# EasyEDA Pro project ProPrj_ROV_MINI_CTRL_2026-11-13.epro, schematic ROV_MINI_CTRL_V2.0.0（无电调）

## Sheets
1 MCU: Assembly Variant: Basic; Board Name: Board3; Create Date: 2026-10-08; Page Name: MCU; Project Name: ROV_MINI_CTRL; Schematic Name: ROV_MINI_CTRL_V2.0.0（无电调）; Update Date: 2026-10-08; Company: 嘉立创EDA; Page Size: A3; Version: V1.0
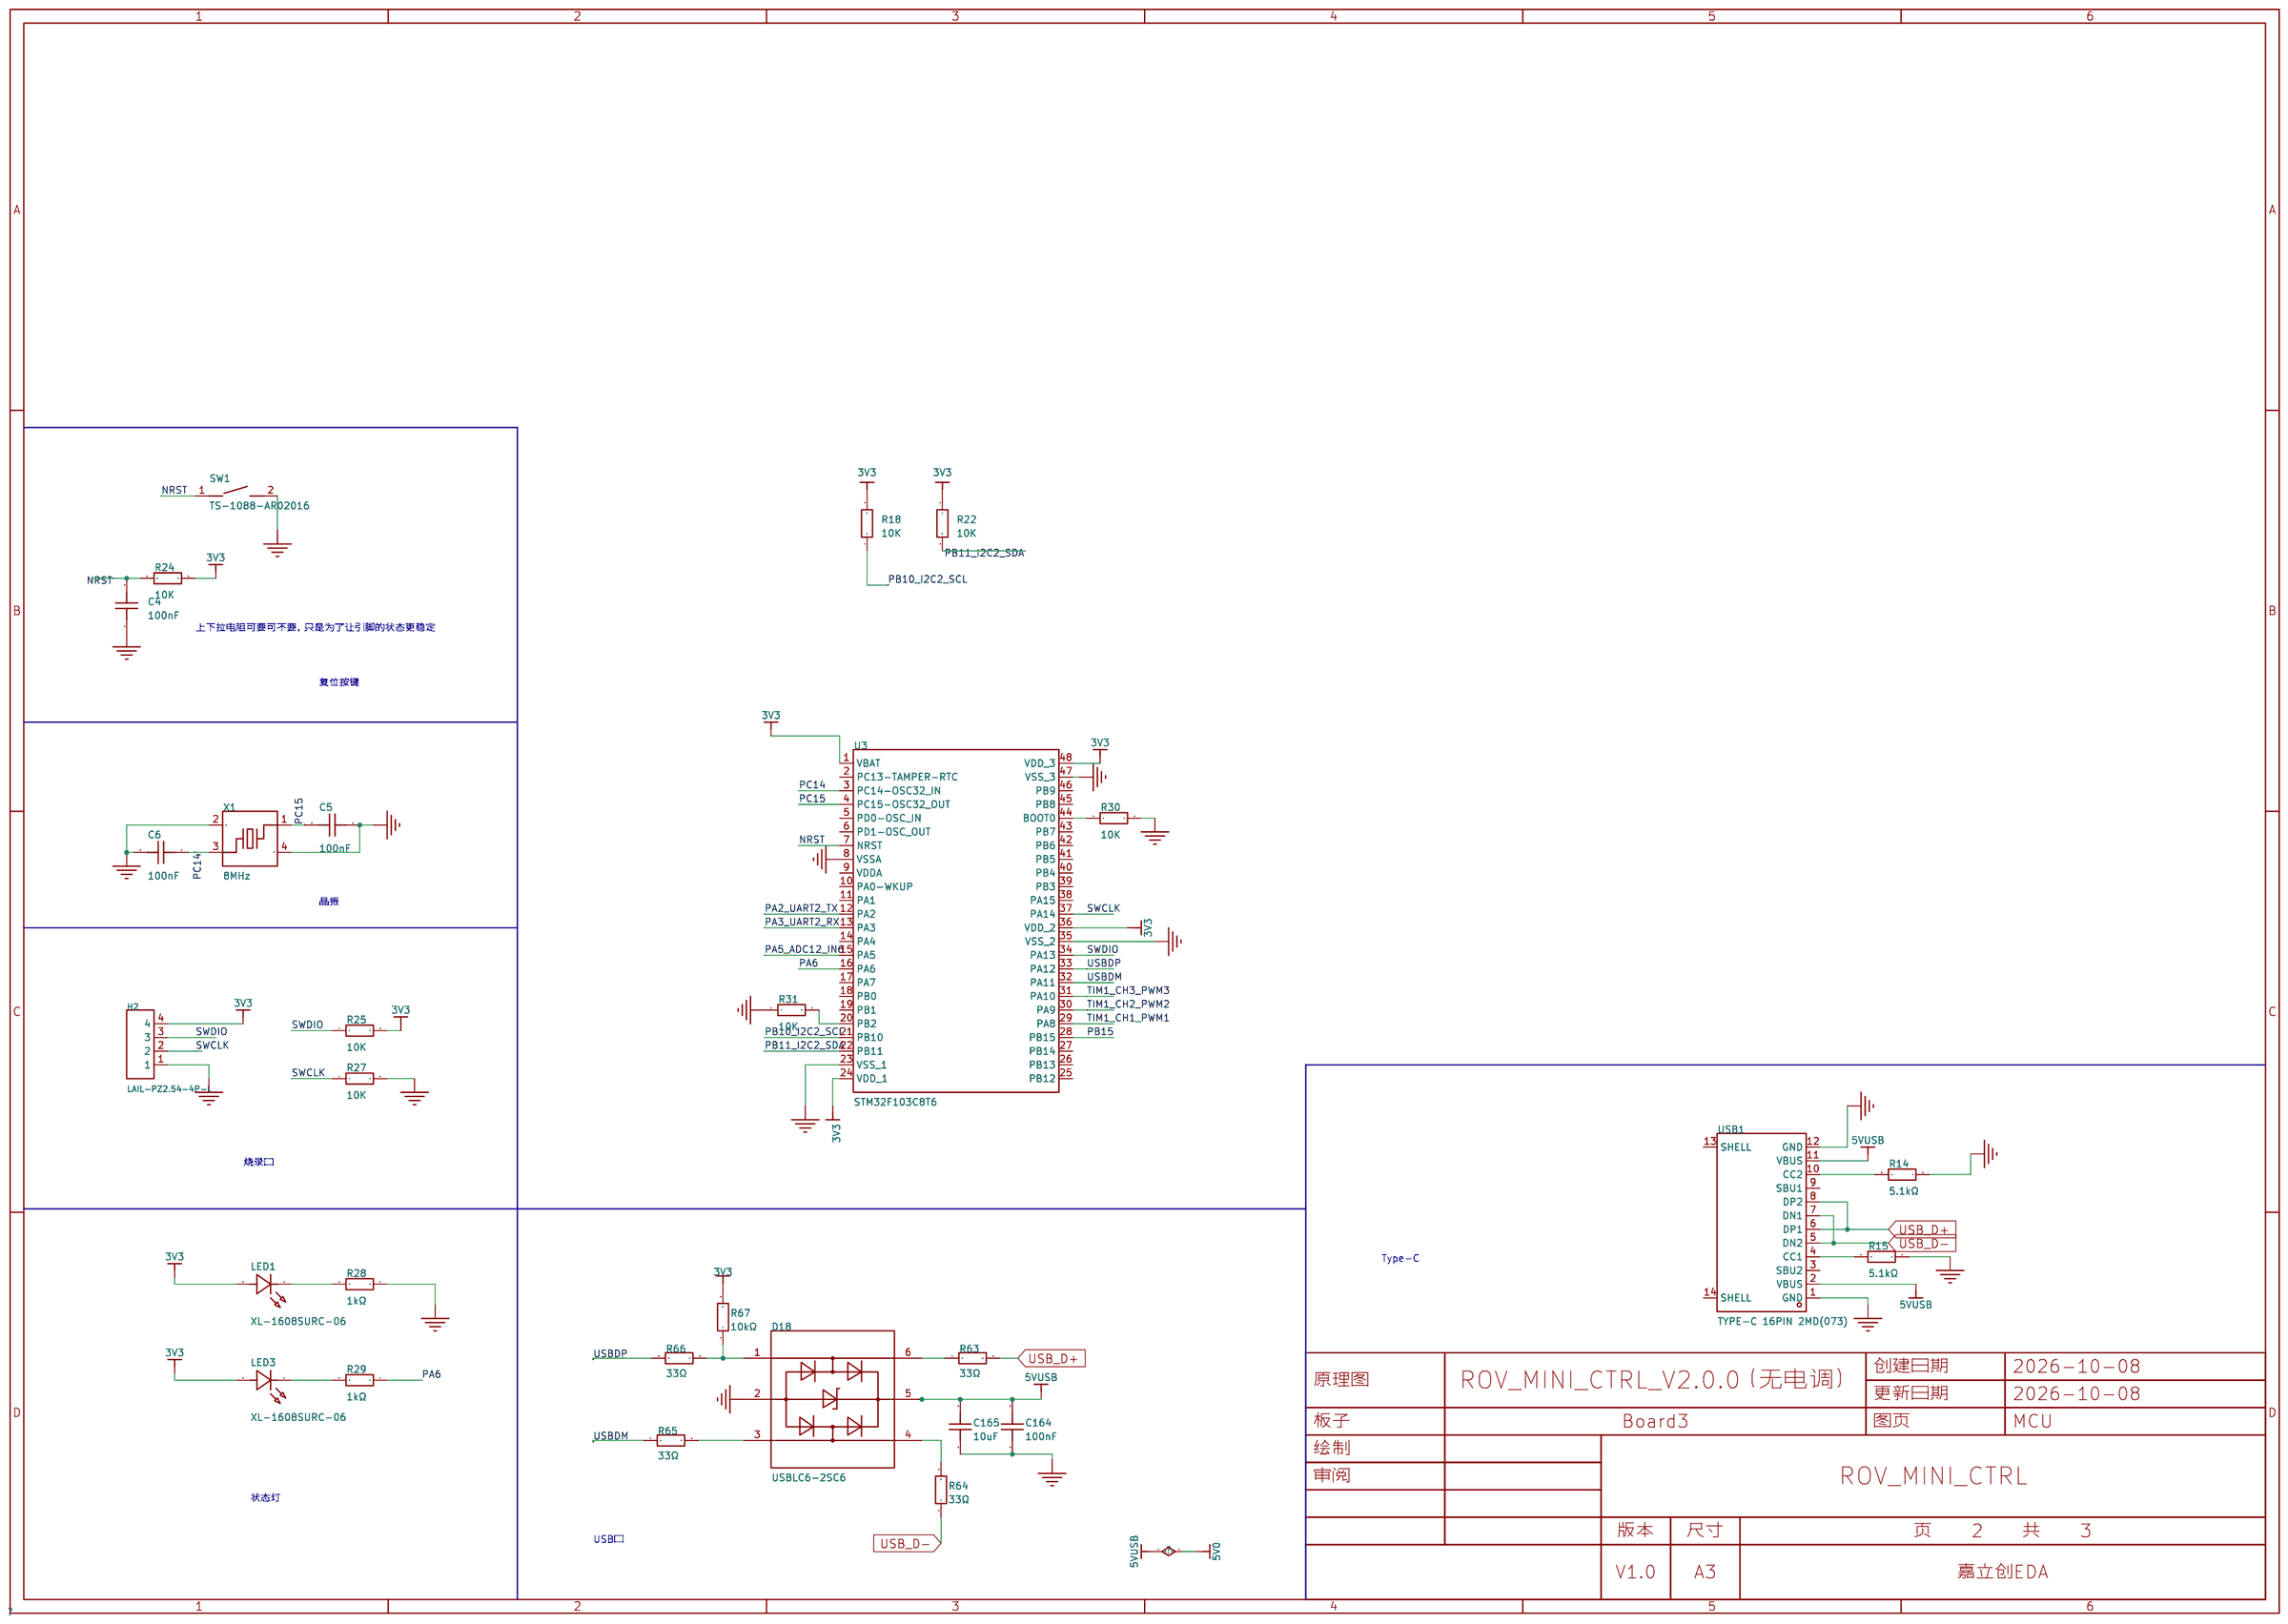
[diagram p0: MCU]
2 POWER: Create Date: 2026-10-05; Page Name: POWER; Update Date: 2026-10-05
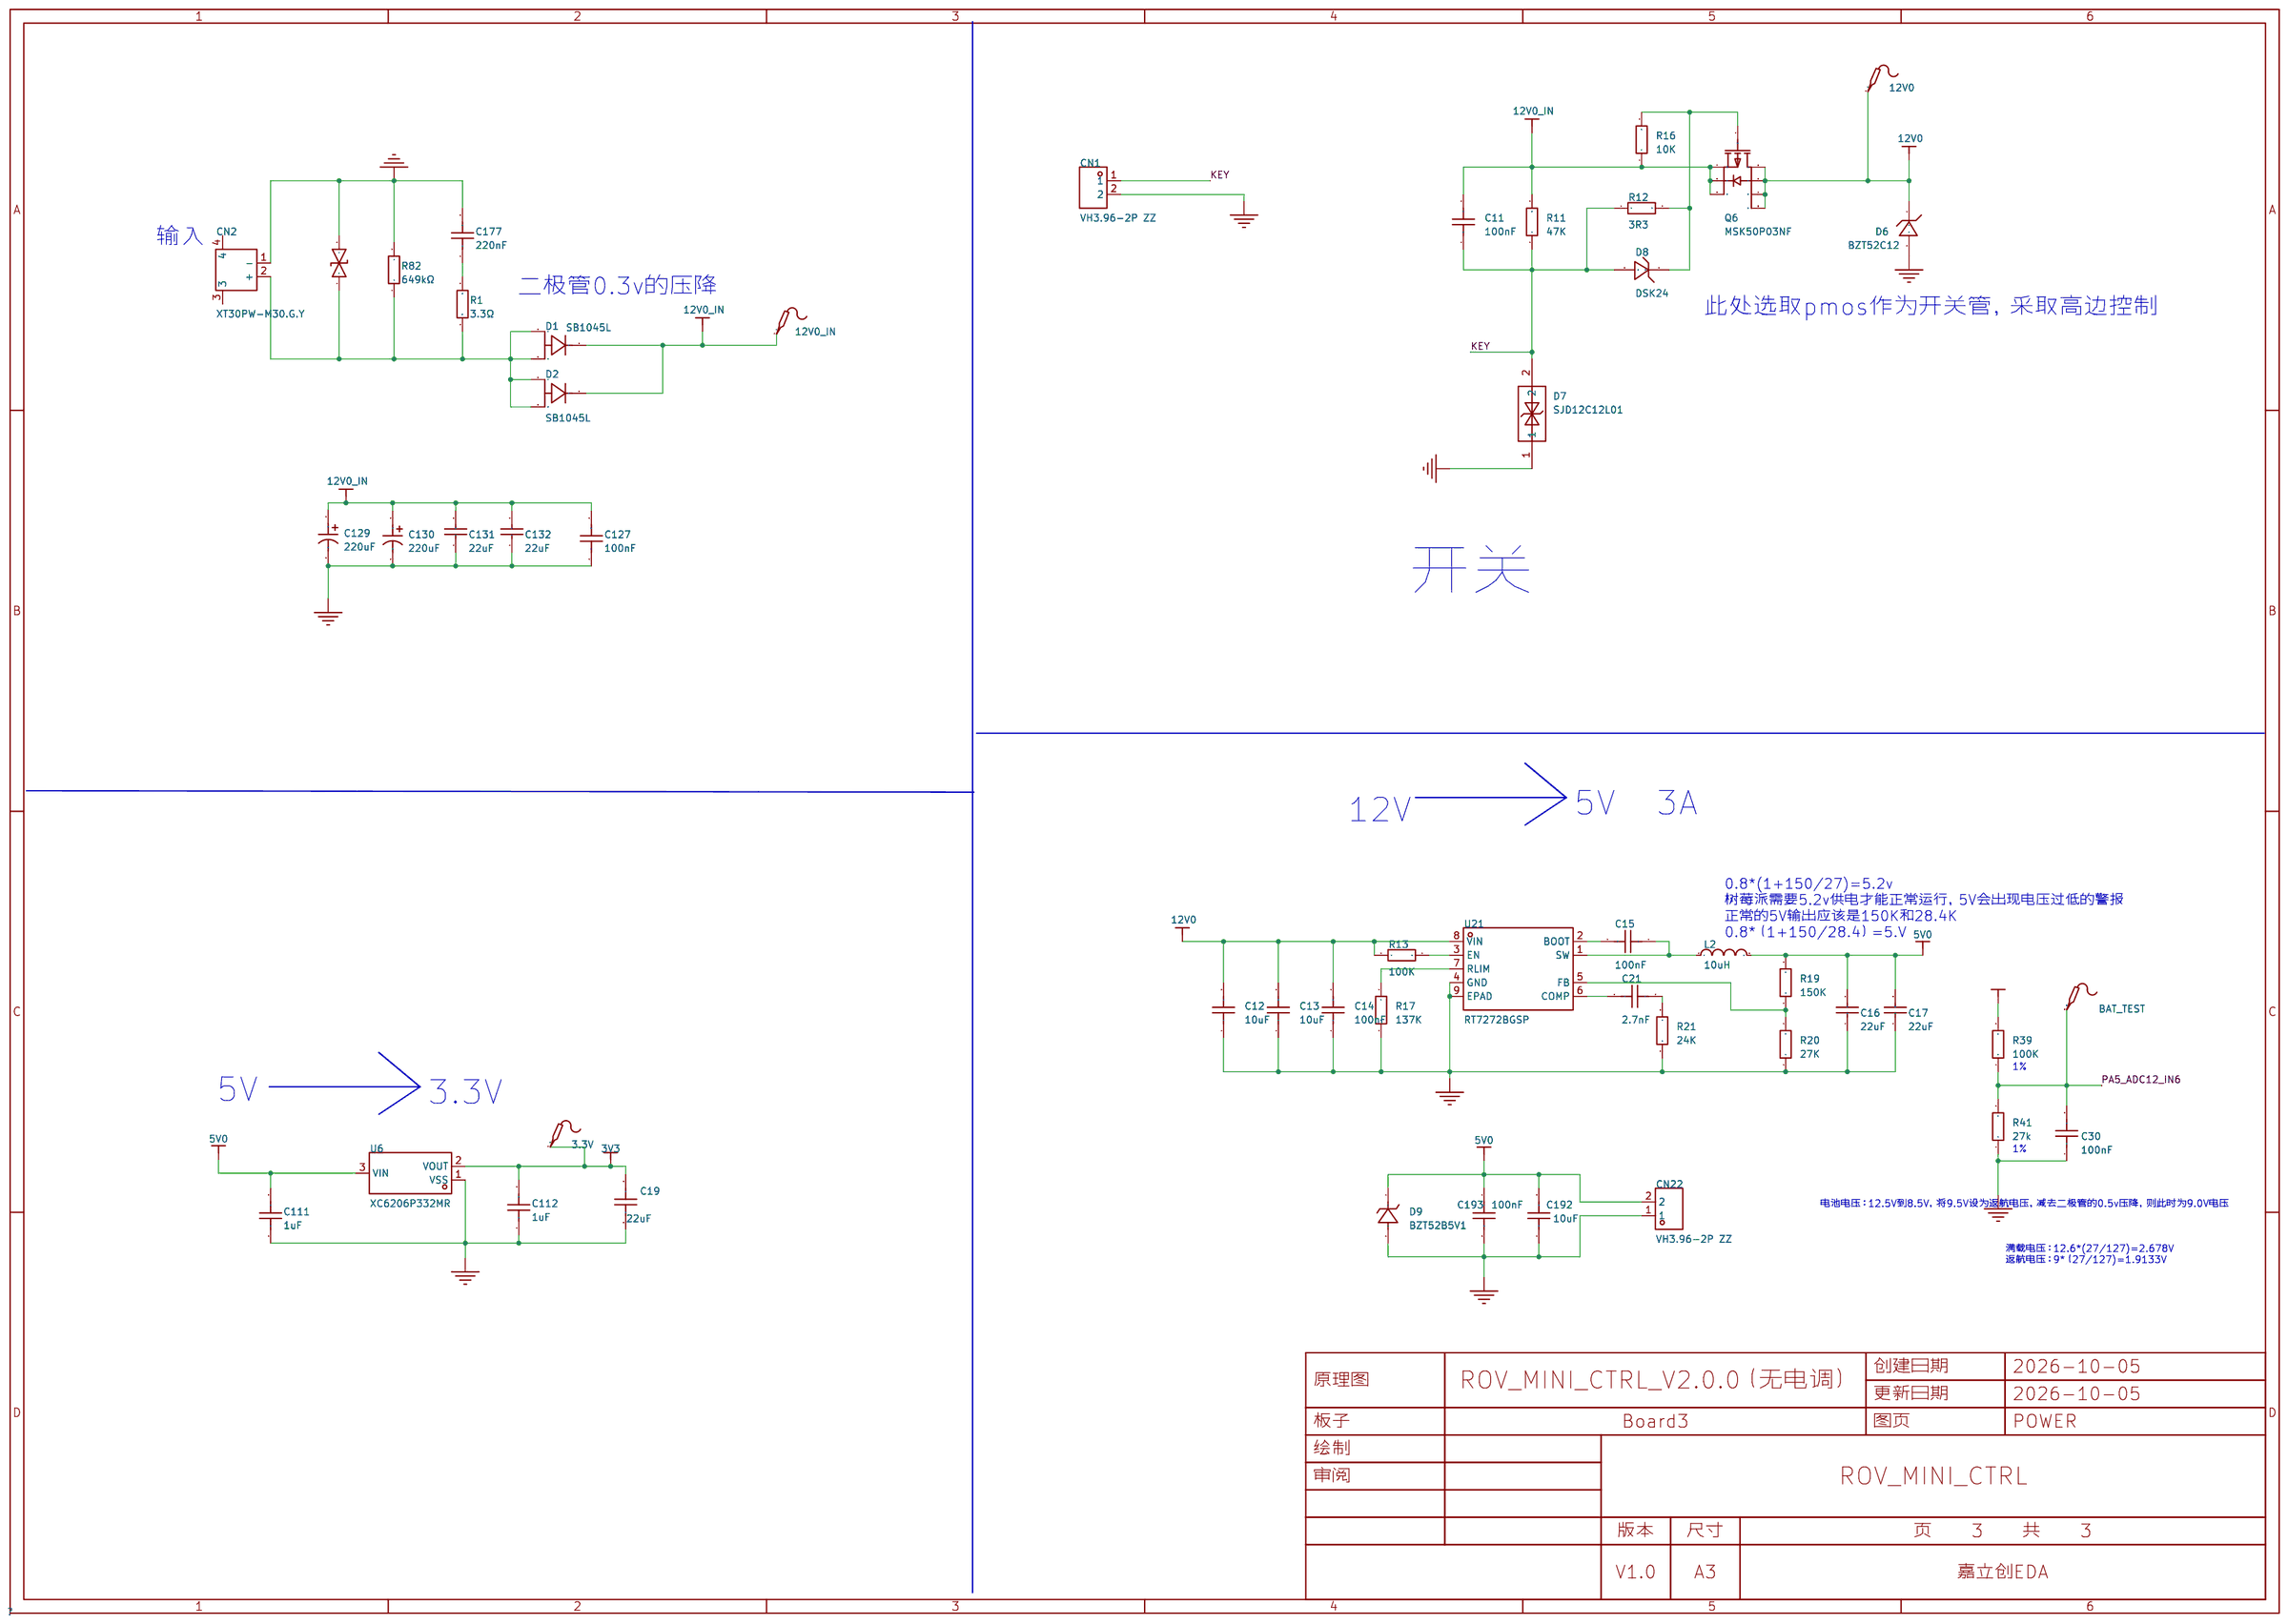
[diagram p1: POWER]
3 abstract: Create Date: 2026-09-11; Page Name: abstract; Update Date: 2026-09-11
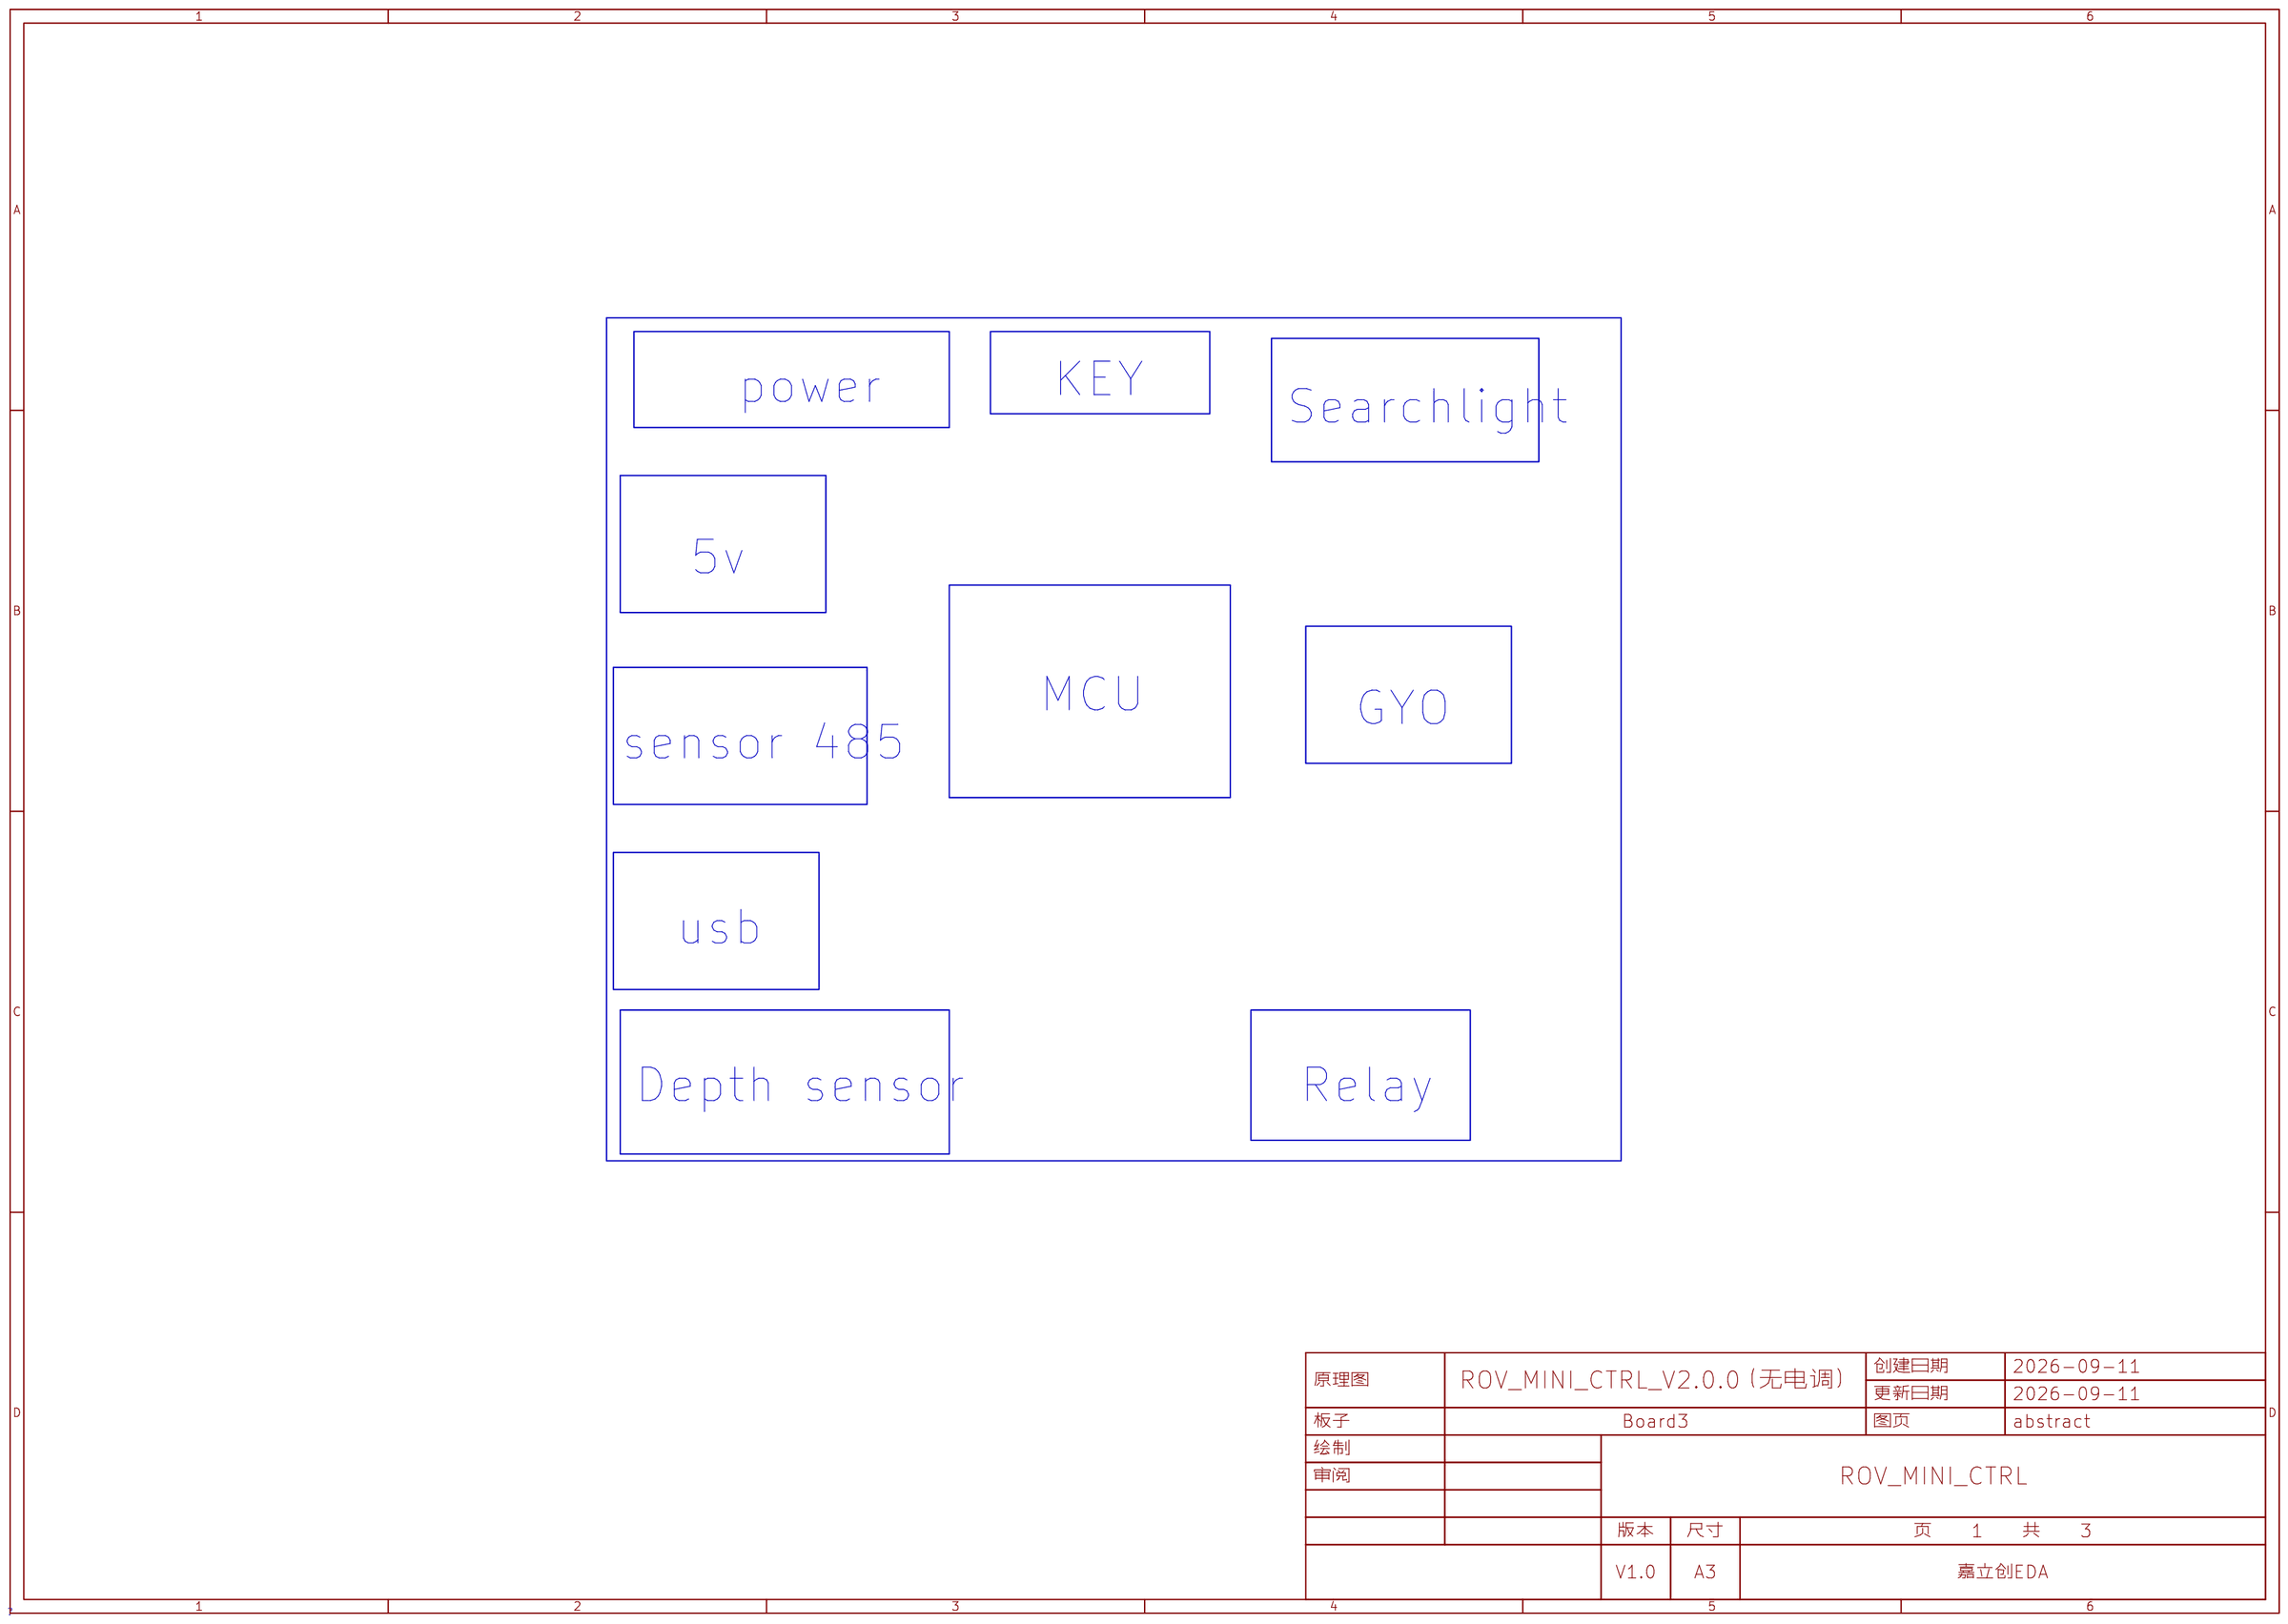
[diagram p2: abstract]

## Parts
sheet MCU
C4  100nF  [C0603]
C5  100nF  [C0603]
C6  100nF  [C0603]
C164  100nF  [C0603]
C165  10uF  [C0603]
D18  USBLC6-2SC6  [SOT-23-6_L2.9-W1.6-P0.95-LS2.8-BL]
H2  LAIL-PZ2.54-4P-L  [CONN-TH_LAIL-PZ2.54-4P-L]
LED1  XL-1608SURC-06  [LED0603-RD_RED]
LED3  XL-1608SURC-06  [LED0603-RD_RED]
R14  5.1kΩ  [R0603]
R15  5.1kΩ  [R0603]
R18  10K  [R0603]
R22  10K  [R0603]
R24  10K  [R0603]
R25  10K  [R0603]
R27  10K  [R0603]
R28  1kΩ  [R0603]
R29  1kΩ  [R0603]
R30  10K  [R0603]
R31  10K  [R0603]
R63  33Ω  [R0603]
R64  33Ω  [R0603]
R65  33Ω  [R0603]
R66  33Ω  [R0603]
R67  10kΩ  [R0603]
SW1  TS-1088-AR02016  [SW-SMD_L3.9-W3.0-P4.45]
U3  STM32F103C8T6  [LQFP-48_L7.0-W7.0-P0.50-LS9.0-BL]
USB1  TYPE-C 16PIN 2MD(073)  [USB-C-SMD_TYPE-C-6PIN-2MD-073]
X1  8MHz  [CRYSTAL-SMD_4P-L3.2-W2.5-BL-1]
sheet POWER
3.3V  -  [Test-Point-0.5mm]
12V0  -  [Test-Point-0.5mm]
12V0_IN  -  [Test-Point-0.5mm]
BAT_TEST  -  [Test-Point-0.5mm]
C11  100nF  [C0603]
C12  10uF  [C0603]
C13  10uF  [C0603]
C14  100nF  [C0603]
C15  100nF  [C0603]
C16  22uF  [C1206]
C17  22uF  [C1206]
C19  22uF  [C0603]
C21  2.7nF  [C0603]
C30  100nF  [C0603]
C111  1uF  [C0603]
C112  1uF  [C0603]
C127  100nF  [C0603]
C129  220uF  [CAP-SMD_BD6.3-L6.6-W6.6-LS7.2-FD]
C130  220uF  [CAP-SMD_BD6.3-L6.6-W6.6-LS7.2-FD]
C131  22uF  [C1206]
C132  22uF  [C1206]
C177  220nF  [C0603]
C192  10uF  [C0603]
C193  100nF  [C0603]
CN1  VH3.96-2P ZZ  [CONN-TH_2P-P3.96_C9900035759]
CN2  XT30PW-M30.G.Y  [CONN-TH_XT30PW-M]
CN22  VH3.96-2P ZZ  [CONN-TH_2P-P3.96_C9900035759]
D1  SB1045L  [TO-277_3P-L5.4-W4.0-LS6.5-TR]
D2  SB1045L  [TO-277_3P-L5.4-W4.0-LS6.5-TR]
D6  BZT52C12  [SOD-123_L2.7-W1.6-LS3.7-RD]
D7  SJD12C12L01  [SOD-123_L2.8-W1.8-LS3.7-BI]
D8  DSK24  [SOD-123FL_L2.7-W1.8-LS3.8-RD]
D9  BZT52B5V1  [SOD-123_L2.7-W1.6-LS3.7-RD]
D10  5.0SMDJ15CA  [SMC_L6.9-W5.9-LS7.9-BI]
L2  10uH  [IND-SMD_L7.1-W6.6]
Q6  MSK50P03NF  [DFN-8_L6.0-W5.0-P1.27-LS6.2-BL]
R1  3.3Ω  [R0603]
R11  47K  [R0603]
R12  3R3  [R0603]
R13  100K  [R0603]
R16  10K  [R0603]
R17  137K  [R0603]
R19  150K  [R0603]
R20  27K  [R0603]
R21  24K  [R0603]
R39  100K  [R0603]
R41  27k  [R0603]
R82  649kΩ  [R0603]
U6  XC6206P332MR  [SOT-23-3_L3.0-W1.7-P0.95-LS2.9-BR]
U21  RT7272BGSP  [SOIC-8_L5.0-W4.0-P1.27-LS6.0-BL-EP2.0]

## Library data of the parts
C4-C6 C11-C15 C21 C30 = CAP_0603: Supplier Footprint: 0603
C127 C164 = CGA0603X7R104K500JT: 容值:100nF;精度:±10%;额定电压:50V;温度系数:X7R;; LCSC Part Name: 100nF ±10% 50V; Supplier Part: C6119867; Manufacturer: HRE(芯声); Supplier Footprint: 0603; JLCPCB Part Class: Extended Part; Datasheet: https://atta.szlcsc.com/upload/public/pdf/source/20250103/C44077DA9E7B3EFAE02F22B6D3D1CBC9.pdf; Supplier: LCSC; Tolerance: ±10%; Voltage Rating: 50V; Temperature Coefficient: X7R
C165 = CL10A106MA8NRNC: 容值:10uF;精度:±20%;额定电压:25V;温度系数:X5R;; LCSC Part Name: 10uF ±20% 25V; Supplier Part: C96446; Manufacturer: SAMSUNG(三星); Supplier Footprint: 0603; JLCPCB Part Class: Basic Part; Datasheet: https://item.szlcsc.com/datasheet/CL10A106MA8NRNC/97651.html; Supplier: LCSC; Tolerance: ±20%; Voltage Rating: 25V; Temperature Coefficient: X5R
D18 = USBLC6-2SC6_C7519: 极性:单向;反向截止电压(Vrwm):5.25V;钳位电压:17V;峰值脉冲电流(Ipp):5A;击穿电压:6V;; LCSC Part Name: 单向ESD; Supplier Part: C7519; Manufacturer: ST(意法半导体); Supplier Footprint: SOT-23-6L; JLCPCB Part Class: 扩展库; Datasheet: https://item.szlcsc.com/datasheet/USBLC6-2SC6/7996.html; Supplier: LCSC; Polarity: 单向; Reverse Stand-Off Voltage (Vrwm): 5.25V; Clamping Voltage: 17V; Peak Pulse Current (Ipp): 5A; Voltage - Breakdown: 6V; Reverse Leakage Current (Ir): 150nA; Number of Channels: 双路; Operating Temperature: -40℃~+125℃; level of protection: IEC 61000-4-2; Type: ESD; Junction Capacitance: 3.5pF
H2 = LAIL-PZ2.54-4P-L: 插针结构:1x4P;间距:2.54mm;圆针/方针:方针;排数:单排;总PIN位数:4P;额定电流:3A;额定电压:250V;塑高:2.5mm;端接针长度:3mm;触头材质:黄铜;触头镀层:金;工作温度:-25℃~+80℃;颜色:黑色;; LCSC Part Name: 1x4P 间距:2.54mm 方针; Supplier Part: C54950602; Manufacturer: 莱联; Supplier Footprint: 插件,P=2.54mm; JLCPCB Part Class: Extended Part; Datasheet: https://item.szlcsc.com/datasheet/LAIL-PZ2.54-4P-L/58519955.html; Supplier: LCSC; Pin Structure: 1x4P; Pitch: 2.54mm; Circluar Pins/Square Pins: 方针; Number of Rows: 单排; Number of Pins: 4P; Current Rating: 3A; Voltage Rating (Max): 250V; Insulation Height: 2.5mm; Length of End Connection Pin: 3mm; Contact Material: 黄铜; Contact Plating: 金; Operating Temperature: -25℃~+80℃; Color: 黑色
LED1 LED3 = XL-1608SURC-06: 灯头类型:-;发光颜色:红色;正向压降(Vf):2.3V;功率:50mW;正向电流:20mA;波长:620nm~630nm;二极管配置:-;透镜颜色:无色透明透镜;色温:-;发光强度:225mcd;发光角度:120°;载带方式:正贴;工作温度:-40℃~+85℃;; LCSC Part Name: 0603红色贴片式发光二极管; Supplier Part: C965799; Manufacturer: XINGLIGHT(成兴光); Supplier Footprint: 0603; JLCPCB Part Class: 扩展库; Datasheet: https://item.szlcsc.com/datasheet/XL-1608SURC-06/1051408.html; Supplier: LCSC; Illumination Color: 红色; Voltage - Forward(Vf): 2.3V; Power(Watts): 50mW; Forward Current: 20mA; Wavelength - Dominant: 620nm~630nm; Peak Wavelength: 625nm; Lens Color: 无色透明透镜; Luminous Intensity: 225mcd; Viewing Angle: 120°; Mounting Style: 正贴; Operating Temperature: -40℃~+85℃
R14 R15 = 0603WAF5101T5E: 电阻类型:厚膜电阻;阻值:5.1kΩ;精度:±1%;功率:100mW;工作电压:75V;温度系数:±100ppm/℃;; LCSC Part Name: 5.1kΩ ±1% 100mW 厚膜电阻; Supplier Part: C23186; Manufacturer: UNI-ROYAL(厚声); Supplier Footprint: 0603; JLCPCB Part Class: Basic Part; Datasheet: https://item.szlcsc.com/datasheet/0603WAF5101T5E/23913.html; Supplier: LCSC; Type: 厚膜电阻; Tolerance: ±1%; Power(Watts): 100mW; Voltage-Supply(Max): 75V; Temperature Coefficient: ±100ppm/℃; Operating Temperature: -55℃~+155℃
R11-R13 R16-R22 R24 R25 R27 R30 R31 R39 R41 = Res_0603: Supplier Footprint: 0603
R28 R29 = 0603WAF1001T5E: 电阻类型:厚膜电阻;阻值:1kΩ;精度:±1%;功率:100mW;工作电压:75V;温度系数:±100ppm/℃;; LCSC Part Name: 1kΩ ±1% 100mW 厚膜电阻; Supplier Part: C21190; Manufacturer: UNI-ROYAL(厚声); Supplier Footprint: 0603; JLCPCB Part Class: Basic Part; Datasheet: https://item.szlcsc.com/datasheet/0603WAF1001T5E/21904.html; Supplier: LCSC; Type: 厚膜电阻; Tolerance: ±1%; Power(Watts): 100mW; Overload Voltage (Max): 75V; Temperature Coefficient: ±100ppm/℃; Operating Temperature Range: -55℃~+155℃; Voltage-Supply(Max): 75V; Operating Temperature: -55℃~+155℃
R63-R66 = FRC0603F33R0TS: 电阻类型:厚膜电阻;阻值:33Ω;精度:±1%;功率:100mW;工作电压:75V;温度系数:±100ppm/℃;; LCSC Part Name: 33Ω ±1% 100mW 厚膜电阻; Supplier Part: C2909394; Manufacturer: FOJAN(富捷); Supplier Footprint: 0603; JLCPCB Part Class: Extended Part; Supplier: LCSC; Type: 厚膜电阻; Tolerance: ±1%; Power(Watts): 100mW; Voltage-Supply(Max): 75V; Temperature Coefficient: ±100ppm/℃; Operating Temperature: -55℃~+155℃
R67 = 0603WAF1002T5E: 电阻类型:厚膜电阻;阻值:10kΩ;精度:±1%;功率:100mW;工作电压:75V;温度系数:±100ppm/℃;; LCSC Part Name: 厚膜电阻 10kΩ ±1% 100mW; Supplier Part: C25804; Manufacturer: UNI-ROYAL(厚声); Supplier Footprint: 0603; JLCPCB Part Class: Basic Part; Datasheet: https://item.szlcsc.com/datasheet/0603WAF1002T5E/26547.html; Supplier: LCSC; Type: 厚膜电阻; Tolerance: ±1%; Power(Watts): 100mW; Voltage-Supply(Max): 75V; Temperature Coefficient: ±100ppm/℃; Operating Temperature: -55℃~+155℃
SW1 = TS-1088-AR02016: 电路结构:单刀单掷;按钮形状:圆形按钮;作用力:1.6N;安装方式:立贴;开关长度:3.9mm;开关宽度:3mm;开关高度:2mm;带支架:不带支架;触点电流:50mA;额定电压:12V;带灯:-;工作寿命:10万次;; LCSC Part Name: 3.9*3*2mm 立贴 轻触开关; Supplier Part: C720477; Manufacturer: XUNPU(讯普); Supplier Footprint: SMD,4x3mm; JLCPCB Part Class: Basic Part; Datasheet: https://item.szlcsc.com/datasheet/TS-1088-AR02016/763484.html; Supplier: LCSC; Circuit: 单刀单掷; Actuator Style: 圆形按钮; Operating Force: 1.6N; Mounting Type: 立贴; Length: 3.9mm; Width: 3mm; Switch Height: 2mm; with Bracket: 不带支架; Contact Current: 50mA; Voltage Rating: 12V; Actuator/Cap Color: 黑色; Termination Style: SMD接片; Life: 10万次; Operating Temperature: -30℃~+80℃
U3 = STM32F103C8T6: CPU内核:ARM Cortex-M3;CPU最大主频:72MHz;CPU位数:32 Bit;; LCSC Part Name: 主流增强型ARM Cortex-M3 MCU，具有64 KB Flash、72 MHz CPU、电机控制、USB和CAN; Supplier Part: C8734; Manufacturer: ST(意法半导体); Supplier Footprint: LQFP-48(7x7); JLCPCB Part Class: Extended Part; Datasheet: https://item.szlcsc.com/datasheet/STM32F103C8T6/9243.html; Supplier: LCSC; CPU Core: ARM Cortex-M3; CPU Maximum Speed: 72MHz; Core Size: 32 Bit; Program Storage Size: 64KB; Program Memory Type: FLASH; RAM Size: 20KB; Number of I/O: 37; ADC (Bit): 12bit; Oscillator Type: 内置; Voltage - Supply: 2V~3.6V; Operating Temperature: -40℃~+85℃
USB1 = TYPE-C 16PIN 2MD(073): 连接器类型:Type-C;协议标准:-;公母:母;安装方式:卧贴;触点数量:16P;端口数量:1;额定电流 - 电源:3A;工作温度:-25℃~+85℃;; LCSC Part Name: Type-C 母 卧贴; Supplier Part: C2765186; Manufacturer: SHOU HAN(首韩); Supplier Footprint: SMD; JLCPCB Part Class: 扩展库; Datasheet: https://item.szlcsc.com/datasheet/TYPE-C%252016PIN%25202MD(073)/2901843.html; Supplier: LCSC; Connector Type: Type-C; Gender: 母; Mounting Type: 卧贴; Number of Contacts: 16P; Number of Ports: 1; Current Rating-Power: 3A; Voltage Rating: 5V; Connect-Disconnect Life: 5千次; Detection color: 黑色; Operating Temperature: -25℃~+85℃
X1 = XL2EL89COI-111YLC-8M: 晶振类型:贴片晶振;频率:8MHz;常温频差:±10ppm;负载电容:12pF;频率稳定度:±20ppm;; LCSC Part Name: YSX321SL 8MHZ 4P 3225 12PF ±10PPM -40~85℃ (±20PPM); Supplier Part: C2973805; Manufacturer: YXC(扬兴晶振); Supplier Footprint: SMD3225-4P; JLCPCB Part Class: Extended Part; Datasheet: https://item.szlcsc.com/datasheet/XL2EL89COI-111YLC-8M/3371202.html; Supplier: LCSC; Type: 贴片晶振; Normal temperature Frequency Tolerance: ±10ppm; Load Capacitance: 12pF; Frequency Stability: ±20ppm; Equivalent Series Resistance(ESR): 180Ω; Operating Temperature: -40℃~+85℃
3.3V 12V0_IN = Test-Point: Test Point 测试点; Check: false
12V0 BAT_TEST = Test-Point: Test Point 测试点
C16 C17 C131 C132 = CL31A226KAHNNNE: 容值:22uF;精度:±10%;额定电压:25V;温度系数:X5R;; LCSC Part Name: 22uF ±10% 25V; Supplier Part: C12891; Manufacturer: SAMSUNG(三星); Supplier Footprint: 1206; JLCPCB Part Class: 基础库; Datasheet: https://item.szlcsc.com/datasheet/CL31A226KAHNNNE/13537.html; Supplier: LCSC; Tolerance: ±10%; Voltage Rating: 25V; Temperature Coefficient: X5R
C19 = CL10A226MQ8NRNC: 容值:22uF;精度:±20%;额定电压:6.3V;温度系数:X5R;; LCSC Part Name: 22uF ±20% 6.3V; Supplier Part: C59461; Manufacturer: SAMSUNG(三星); Supplier Footprint: 0603; JLCPCB Part Class: Basic Part; Datasheet: https://item.szlcsc.com/datasheet/CL10A226MQ8NRNC/60514.html; Supplier: LCSC; Tolerance: ±20%; Voltage Rating: 6.3V; Temperature Coefficient: X5R
C111 C112 = CGA0603X5R105K500JT: 容值:1uF;精度:±10%;额定电压:50V;温度系数:X5R;; LCSC Part Name: 1uF ±10% 50V; Supplier Part: C6119852; Manufacturer: HRE(芯声); Supplier Footprint: 0603; JLCPCB Part Class: Extended Part; Supplier: LCSC; Tolerance: ±10%; Voltage Rating: 50V; Temperature Coefficient: X5R
C129 C130 = RVT1C221M0607 220UF 16V: 容值:220uF;精度:±20%;额定电压:16V;纹波电流:110mA@120Hz;等效串联电阻(ESR):-;; LCSC Part Name: 220uF ±20% 16V; Supplier Part: C970695; Manufacturer: DMBJ(振宝佳); Supplier Footprint: SMD,D6.3xL7.7mm; JLCPCB Part Class: 扩展库; Datasheet: https://item.szlcsc.com/datasheet/RVT1C221M0607%2520220UF%252016V/1060423.html; Supplier: LCSC; Tolerance: ±20%; Voltage Rating: 16V; Ripple Current: 110mA@120Hz; Diameter: 6.3mm; Height - Seated (Max): 7.7mm; Lifetime: 2000hrs@105℃; Operating Temperature: -55℃~+105℃
C177 = FCC0603B224K500CT: 容值:220nF;精度:±10%;额定电压:50V;温度系数:X7R;; LCSC Part Name: ±0.25pF 220nF ±10% 50V; Supplier Part: C5137500; Manufacturer: FOJAN(富捷); Supplier Footprint: 0603; JLCPCB Part Class: Extended Part; Datasheet: https://item.szlcsc.com/datasheet/FCC0603B224K500CT/5747002.html; Supplier: LCSC; Tolerance: ±10%; Voltage Rating: 50V; Temperature Coefficient: X7R
C192 C193 = CAP_0603: Supplier Footprint: 0603; Sim Model: eb8db00cf755486a99d82f511adf71ce; Sim Model Title: Capacitor; Sim Model Path: 0819f05c4eef4c71ace90d822a990e87; NGSpice Model: b0400270a9e64a8faba05adf23a90584; NGSpice Model Title: Capacitor; NGspice Model Path: 0819f05c4eef4c71ace90d822a990e87
CN1 CN22 = VH3.96-2P ZZ: 插针结构:1x2P;间距:3.96mm;安装方式:直插;参考系列:VH;总PIN数:2P;排数:1;每排PIN数:2;行距:-;额定电流:7A;触头材质:黄铜;触头镀层:锡;工作温度:-25℃~+85℃;; LCSC Part Name: 1x2P 间距:3.96mm 直插 系列:VH; Supplier Part: C5379868; Manufacturer: SHOU HAN(首韩); Supplier Footprint: 插件,P=3.96mm; JLCPCB Part Class: 扩展库; Datasheet: https://item.szlcsc.com/datasheet/VH3.96-2P%2520ZZ/6244976.html; Supplier: LCSC; Pins Structure: 1x2P; Pitch: 3.96mm; Mounting Type: 直插; Reference Series: VH; Number of Pins: 2P; Number of Rows: 1; Number of PINs Per Row: 2; Current Rating: 7A; Contact Material: 黄铜; Contact Plating: 锡; Operating Temperature: -25℃~+85℃; Voltage Rating: 250V; Plastic Material: PA66; Flame Retardant Rating: UL94V-0; Color: 白色
CN2 = XT30PW-M30.G.Y: 类别:-;类型1:-;; LCSC Part Name: AMASS(艾迈斯)航模插头 卧式弯脚 XT30PW-M公头; Supplier Part: C431092; Manufacturer: AMASS(艾迈斯); JLCPCB Part Class: 扩展库; Datasheet: https://item.szlcsc.com/datasheet/XT30PW-M30.G.Y/426930.html; Supplier: LCSC; Type: 航模插头; RatedVoltage: DC 500V; InterfaceType: 公头; RatedCurrent: 15A; RecommendedWireGauge: 16/18/20AWG; contact resistance: 1.2mΩ; specifications: 2pin
D1 D2 = SB1045L_C908747: 二极管配置:独立式;正向压降(Vf):530mV@10A;直流反向耐压(Vr):45V;整流电流:10A;; LCSC Part Name: 电压:45V 电流:10A; Supplier Part: C908747; Manufacturer: GOODWORK(固得沃克); Supplier Footprint: TO-277; JLCPCB Part Class: 扩展库; Datasheet: https://item.szlcsc.com/datasheet/SB1045L/975499.html; Supplier: LCSC; Diode Configuration: 独立式; Voltage - Forward(Vf@If): 530mV@10A; Voltage - DC Reverse(Vr): 45V; Current - Rectified: 10A; Reverse Leakage Current (Ir): 150uA; Non-Repetitive Peak Forward Surge Current: 150A
D6 = BZT52C12_C173429: 二极管配置:1个独立式;稳压值(标称值):12V;稳压值(范围值):11.4V~12.6V;耗散功率(Pd):500mW;; LCSC Part Name: 独立式 耐压:12V 电流:0.1uA@9V; Supplier Part: C173429; Manufacturer: MDD(辰达半导体); Supplier Footprint: SOD-123; JLCPCB Part Class: Extended Part; Datasheet: https://item.szlcsc.com/datasheet/BZT52C12/184818.html; Supplier: LCSC; Diode Configuration: 1个独立式; Zener Voltage(Nom): 12V; Reverse Leakage Current (Ir): 100nA@9V; Zener Voltage(Range): 11.4V~12.6V; Pd - Power Dissipation: 500mW; Impedance(Zzt): 35Ω; Tolerance: ±5%
D7 = SJD12C12L01: 极性:双向;反向截止电压(Vrwm):12V;钳位电压:19.9V;峰值脉冲电流(Ipp):10.1A;峰值脉冲功率(Ppp):1kW@8/20us;击穿电压:13.3V;; LCSC Part Name: 双向ESD 12V截止 峰值脉冲电流：10.1A; Supplier Part: C313270; Manufacturer: Brightking(君耀电子); Supplier Footprint: SOD-123S; JLCPCB Part Class: Extended Part; Datasheet: https://item.szlcsc.com/datasheet/SJD12C12L01/295826.html; Supplier: LCSC; Polarity: 双向; Reverse Stand-Off Voltage (Vrwm): 12V; Clamping Voltage: 19.9V; Peak Pulse Current (Ipp): 10.1A; Peak Pulse Power Dissipation (Ppp): 1kW@8/20us; Voltage - Breakdown: 13.3V; Reverse Leakage Current (Ir): 1uA; Number of Channels: 单路; Operating Temperature: -55℃~+150℃; level of protection: IEC 61000-4-2; Type: ESD
D8 = DSK24_C22466352: 二极管配置:独立式;正向压降(Vf):550mV@2A;直流反向耐压(Vr):40V;整流电流:2A;; LCSC Part Name: 电压:40V 电流:2A; Supplier Part: C22466352; Manufacturer: R+O(宏嘉诚); Supplier Footprint: SOD-123FL; JLCPCB Part Class: Extended Part; Datasheet: https://item.szlcsc.com/datasheet/DSK24/24165511.html; Supplier: LCSC; Diode Configuration: 独立式; Voltage - Forward(Vf@If): 550mV@2A; Voltage - DC Reverse(Vr): 40V; Current - Rectified: 2A; Reverse Leakage Current (Ir): 500uA@40V; Operating Junction Temperature Range: -55℃~+125℃; Non-Repetitive Peak Forward Surge Current: 50A
D9 = BZT52B5V1_C19077393: 二极管配置:独立式;稳压值(标称值):5.1V;稳压值(范围):5V~5.2V;耗散功率(Pd):500mW;; LCSC Part Name: 独立式 耐压:5.1V 电流:2uA@2V; Supplier Part: C19077393; Manufacturer: R+O(宏嘉诚); Supplier Footprint: SOD-123; JLCPCB Part Class: Extended Part; Datasheet: https://item.szlcsc.com/datasheet/BZT52B5V1/20275478.html; Supplier: LCSC; Diode Configuration: 独立式; Zener Voltage(Nom): 5.1V; Reverse Leakage Current (Ir): 2uA@2V; Zener Voltage(Range): 5V~5.2V; Pd - Power Dissipation: 500mW; Impedance(Zzt): 60Ω; Impedance(Zzk): 480Ω; Operating Junction Temperature Range: -55℃~+150℃
D10 = 5.0SMDJ15CA_C42394444: 极性:双向;反向截止电压(Vrwm):15V;钳位电压:24.4V;峰值脉冲电流(Ipp):204.9A@10/1000us;峰值脉冲功率(Ppp):5kW@10/1000us;击穿电压:18.5V;; LCSC Part Name: 双向TVS 15V截止 峰值浪涌电流：204.9A@10/1000us; Supplier Part: C42394444; Manufacturer: R+O(宏嘉诚); Supplier Footprint: DO-214AB(SMC); JLCPCB Part Class: 扩展库; Datasheet: https://item.szlcsc.com/datasheet/5.0SMDJ15CA/44336002.html; Supplier: LCSC; Polarity: 双向; Reverse Stand-Off Voltage (Vrwm): 15V; Clamping Voltage: 24.4V; Peak Pulse Current (Ipp): 204.9A@10/1000us; Peak Pulse Power Dissipation (Ppp): 5kW@10/1000us; Voltage - Breakdown: 18.5V; Reverse Leakage Current (Ir): 100uA; Operating Temperature: -55℃~+150℃; level of protection: IEC 61000-4-2; Type: TVS
L2 = MWSA0603S-100MT: 电感值:10uH;精度:±20%;额定电流:4.5A;饱和电流(Isat):5.5A;类型:-;; LCSC Part Name: 10uH ±20% 5.5A; Supplier Part: C132141; Manufacturer: Sunlord(顺络); Supplier Footprint: SMD,7x6.6mm; JLCPCB Part Class: Extended Part; Datasheet: https://item.szlcsc.com/datasheet/MWSA0603S-100MT/143440.html; Supplier: LCSC; Tolerance: ±20%; Current Rating: 4.5A; Current - Saturation(Isat): 5.5A; DC Resistance(DCR): 67mΩ
Q6 = MSK50P03NF: 数量:-;漏源电压(Vdss):30V;连续漏极电流(Id):50A;导通电阻(RDS(on)):9mΩ@10V；18mΩ@4.5V;耗散功率(Pd):3W;阈值电压(Vgs(th)):1.5V;; LCSC Part Name: P沟道 MOSFET,电流:-50A,耐压:-30V; Supplier Part: C2902919; Manufacturer: MSKSEMI(美森科); Supplier Footprint: DFN-8(5x6); JLCPCB Part Class: Extended Part; Datasheet: https://item.szlcsc.com/datasheet/MSK50P03NF/3157373.html; Supplier: LCSC; Drain to Source Voltage: 30V; Current - Continuous Drain(Id): 50A; RDS(on): 9mΩ@10V；18mΩ@4.5V; Pd - Power Dissipation: 3W; Gate Threshold Voltage (Vgs(th)): 1.5V; Gate Charge(Qg): 24nC@10V; Input Capacitance(Ciss): 1.75nF; Reverse Transfer Capacitance (Crss@Vds): 180pF; Operating Temperature: -55℃~+150℃; Type: P沟道; Output Capacitance(Coss): 215pF
R1 = FRC0603F3R30TS: 电阻类型:厚膜电阻;阻值:3.3Ω;精度:±1%;功率:100mW;工作电压:75V;温度系数:±200ppm/℃;; LCSC Part Name: 3.3Ω ±1% 100mW 厚膜电阻; Supplier Part: C2930016; Manufacturer: FOJAN(富捷); Supplier Footprint: 0603; JLCPCB Part Class: Extended Part; Supplier: LCSC; Type: 厚膜电阻; Tolerance: ±1%; Power(Watts): 100mW; Voltage-Supply(Max): 75V; Temperature Coefficient: ±200ppm/℃; Operating Temperature: -55℃~+155℃
R82 = RC0603FR-07649KL: 电阻类型:厚膜电阻;阻值:649kΩ;精度:±1%;功率:100mW;工作电压:75V;温度系数:±100ppm/℃;; LCSC Part Name: 厚膜电阻 649kΩ ±1% 100mW; Supplier Part: C245991; Manufacturer: YAGEO(国巨); Supplier Footprint: 0603; JLCPCB Part Class: Extended Part; Datasheet: https://item.szlcsc.com/datasheet/RC0603FR-07649KL/243492.html; Supplier: LCSC; Type: 厚膜电阻; Tolerance: ±1%; Power(Watts): 100mW; Voltage-Supply(Max): 75V; Temperature Coefficient: ±100ppm/℃; Operating Temperature: -55℃~+155℃
U6 = XC6206P332MR_C347376: 输出类型:固定;工作电压:8V;输出电压:3.3V;输出电流:250mA;电源纹波抑制比(PSRR):40dB@(1kHz);输出极性:正极;; LCSC Part Name: 高纹波抑制率、低功耗、低压差 CMOS 降压型电压稳压器; Supplier Part: C347376; Manufacturer: UMW(友台半导体); Supplier Footprint: SOT-23; JLCPCB Part Class: 扩展库; Datasheet: https://item.szlcsc.com/datasheet/XC6206P332MR/324036.html; Supplier: LCSC; Output Type: 固定; Voltage - Supply: 8V; Output Voltage: 3.3V; Output Current: 250mA; Power Supply Rejection Ratio (PSRR): 40dB@(1kHz); Voltage Dropout: 240mV@(50mA); standby current: 7uA; Features: 过流保护；短路保护; Operating Temperature: -25℃~+80℃@(Ta); Output Configuration: 正极; Number of Outputs: 1
U21 = RT7272BGSP: 功能类型:降压型;输出类型:可调;工作电压:4.5V~36V;输出电压:800mV~30V;输出电流:3A;; LCSC Part Name: 3A, 36V, 500kHz 同步降压转换器; Supplier Part: C127866; Manufacturer: RICHTEK(立锜); Supplier Footprint: SOIC-8-EP; JLCPCB Part Class: Extended Part; Datasheet: https://atta.szlcsc.com/upload/public/pdf/source/20180403/C127866_C96022CD8724BC3A1F23EF273B4658E0.pdf; Supplier: LCSC; Function: 降压型; Output Type: 可调; Input Voltage: 4.5V~36V; Output Voltage: 800mV~30V; Output Current: 3A; Switching Frequency: 500kHz; Operating Temperature: -40℃~+125℃; Synchronous Rectification: 是; Number of Outputs: 1; Topology: 降压式; Quiescent Current (Iq): 900uA; Switch tube (built-in/external): 内置

## Nets
3V3: 3.3V.1 C19.1 C112.2 H2.4 LED1.2(A) LED3.2(A) R18.2 R22.1 R24.1 R25.2 R67.2 U3.1(VBAT) U3.24(VDD_1) U3.36(VDD_2) U3.48(VDD_3) U6.2(VOUT)
5V0: C16.2 C17.2 C111.2 C164.2 C165.2 C192.2 C193.1 CN22.2 D9.1(K) D18.5 L2.2 R19.2 U6.3(VIN) USB1.2(VBUS) USB1.11(VBUS)
12V0: 12V0.1 C12.2 C13.2 C14.2 D6.1(K) Q6.5(D) Q6.6(D) Q6.7(D) Q6.8(D) R13.2 R39.2 U21.8(VIN)
12V0_IN: 12V0_IN.1 C11.2 C127.2 C129.1 C130.1 C131.2 C132.2 D1.2(K) D2.2(K) Q6.1(S) Q6.2(S) Q6.3(S) R11.2 R16.1
GND: C4.1 C5.1 C6.2 C12.1 C13.1 C14.1 C16.1 C17.1 C19.2 C30.1 C111.1 C112.1 C127.1 C129.2 C130.2 C131.1 C132.1 C164.1 C165.1 C177.2 C192.1 C193.2 CN1.2 CN2.1(-) CN22.1 D6.2(A) D7.1 D9.2(A) D10.2(A) D18.2 H2.1 R14.1 R15.1 R17.2 R20.1 R21.1 R27.2 R28.1 R30.2 R31.1 R41.1 R82.2 SW1.2 U3.8(VSSA) U3.23(VSS_1) U3.35(VSS_2) U3.47(VSS_3) U6.1(VSS) U21.4(GND) U21.9(EPAD) USB1.1(GND) USB1.12(GND) X1.2(GND) X1.4(GND)
KEY: C11.1 CN1.1 D7.2 D8.2(A) R11.1 R12.1
NRST: C4.2 R24.2 SW1.1 U3.7(NRST)
PA2_UART2_TX: U3.12(PA2)
PA3_UART2_RX: U3.13(PA3)
PA5_ADC12_IN6: BAT_TEST.1 C30.2 R39.1 R41.2 U3.15(PA5)
PA6: R29.1 U3.16(PA6)
PB10_I2C2_SCL: R18.1 U3.21(PB10)
PB11_I2C2_SDA: R22.2 U3.22(PB11)
PB15: U3.28(PB15)
PC14: C6.1 U3.3(PC14-OSC32_IN) X1.3
PC15: C5.2 U3.4(PC15-OSC32_OUT) X1.1
SWCLK: H2.2 R27.1 U3.37(PA14)
SWDIO: H2.3 R25.1 U3.34(PA13)
TIM1_CH1_PWM1: U3.29(PA8)
TIM1_CH2_PWM2: U3.30(PA9)
TIM1_CH3_PWM3: U3.31(PA10)
USB_D+: R63.2 USB1.6(DP1) USB1.8(DP2)
USB_D-: R64.1 USB1.5(DN2) USB1.7(DN1)
USBDM: R65.1 U3.32(PA11)
USBDP: R66.1 U3.33(PA12)
$3N53629: LED1.1(K) R28.2
$3N53632: LED3.1(K) R29.2
$3N53642: R30.1 U3.44(BOOT0)
$3N53655: R31.2 U3.20(PB2)
$3N53682: R15.2 USB1.4(CC1)
$3N53683: R14.2 USB1.10(CC2)
$3N53689: D18.3 R65.2
$3N53690: D18.1 R66.2 R67.1
$3N53694: D18.4 R64.2
$3N53697: D18.6 R63.1
$9N1151: CN2.2(+) D1.1(A) D1.3(A) D2.1(A) D2.3(A) D10.1(K) R1.1 R82.1
$9N50445: R13.1 U21.3(EN)
$9N50446: R17.1 U21.7(RLIM)
$9N50450: C15.2 U21.2(BOOT)
$9N50451: C15.1 L2.1 U21.1(SW)
$9N50452: R19.1 R20.2 U21.5(FB)
$9N50454: C21.2 U21.6(COMP)
$9N50457: C21.1 R21.2
$9N50462: D8.1(C) Q6.4(G) R12.2 R16.2
$9N50469: C177.1 R1.2

Not connected (* = marked no-connect by the designer): CN2 3 4; U3 2(PC13-TAMPER-RTC) 5(PD0-OSC_IN) 6(PD1-OSC_OUT) 9(VDDA) 10(PA0-WKUP) 11(PA1) 14(PA4) 17(PA7) 18(PB0) 19(PB1) 25(PB12) 26(PB13) 27(PB14) 38(PA15) 39(PB3) 40(PB4) 41(PB5) 42(PB6) 43(PB7) 45(PB8) 46(PB9); USB1 3(SBU2) 9(SBU1) 13(SHELL) 14(SHELL)

## Notes on the sheets
sheet 1
- 上下拉电阻可要可不要，只是为了让引脚的状态更稳定
- 复位按键
- 晶振
- 烧录口
- Type-C
- 状态灯
- USB口
sheet 2
- 输入
- 二极管0.3v的压降
- 此处选取pmos作为开关管，采取高边控制
- 开关
- 12V
- 5V
- 3A
- 0.8*(1+150/27)=5.2v
  树莓派需要5.2v供电才能正常运行，5V会出现电压过低的警报
  正常的5V输出应该是150K和28.4K
  0.8*（1+150/28.4）=5.V
- 1%
- 5V
- 3.3V
- 1%
- 电池电压：12.5V到8.5V，将9.5V设为返航电压，减去二极管的0.5v压降，则此时为9.0V电压
- 满载电压：12.6*(27/127)=2.678V
  返航电压：9*（27/127)=1.9133V
sheet 3
- KEY
- power
- Searchlight
- 5v
- MCU
- GYO
- sensor 485
- usb
- Depth sensor
- Relay
